# Altium schematic sheet ControlBoard.schdoc
size 297 x 209 mm; Symbol: Drawing-Symbol_A4; Company: 上海道尔汇控智能科技有限公司; Version: V1.1; Page Size: A4; @Project Name: YTM32; @Page Count: 1; @Update Date: 2025-12-09; @Create Date: 2025-10-20; @Schematic Name: YTM32_64pin; @Page No: 1; @Page Name: ControlBoard; @Create Time: 16:39:05; @Update Time: 20:38:16; Border: 1; Width: 1170; Height: 825; Region Start: 1; X Region Count: 6; Y Region Count: 4; Blade Width: 10; Title Block Position: 3; @Board Name: YTM32_64pin; Device: Drawing-Symbol_A4
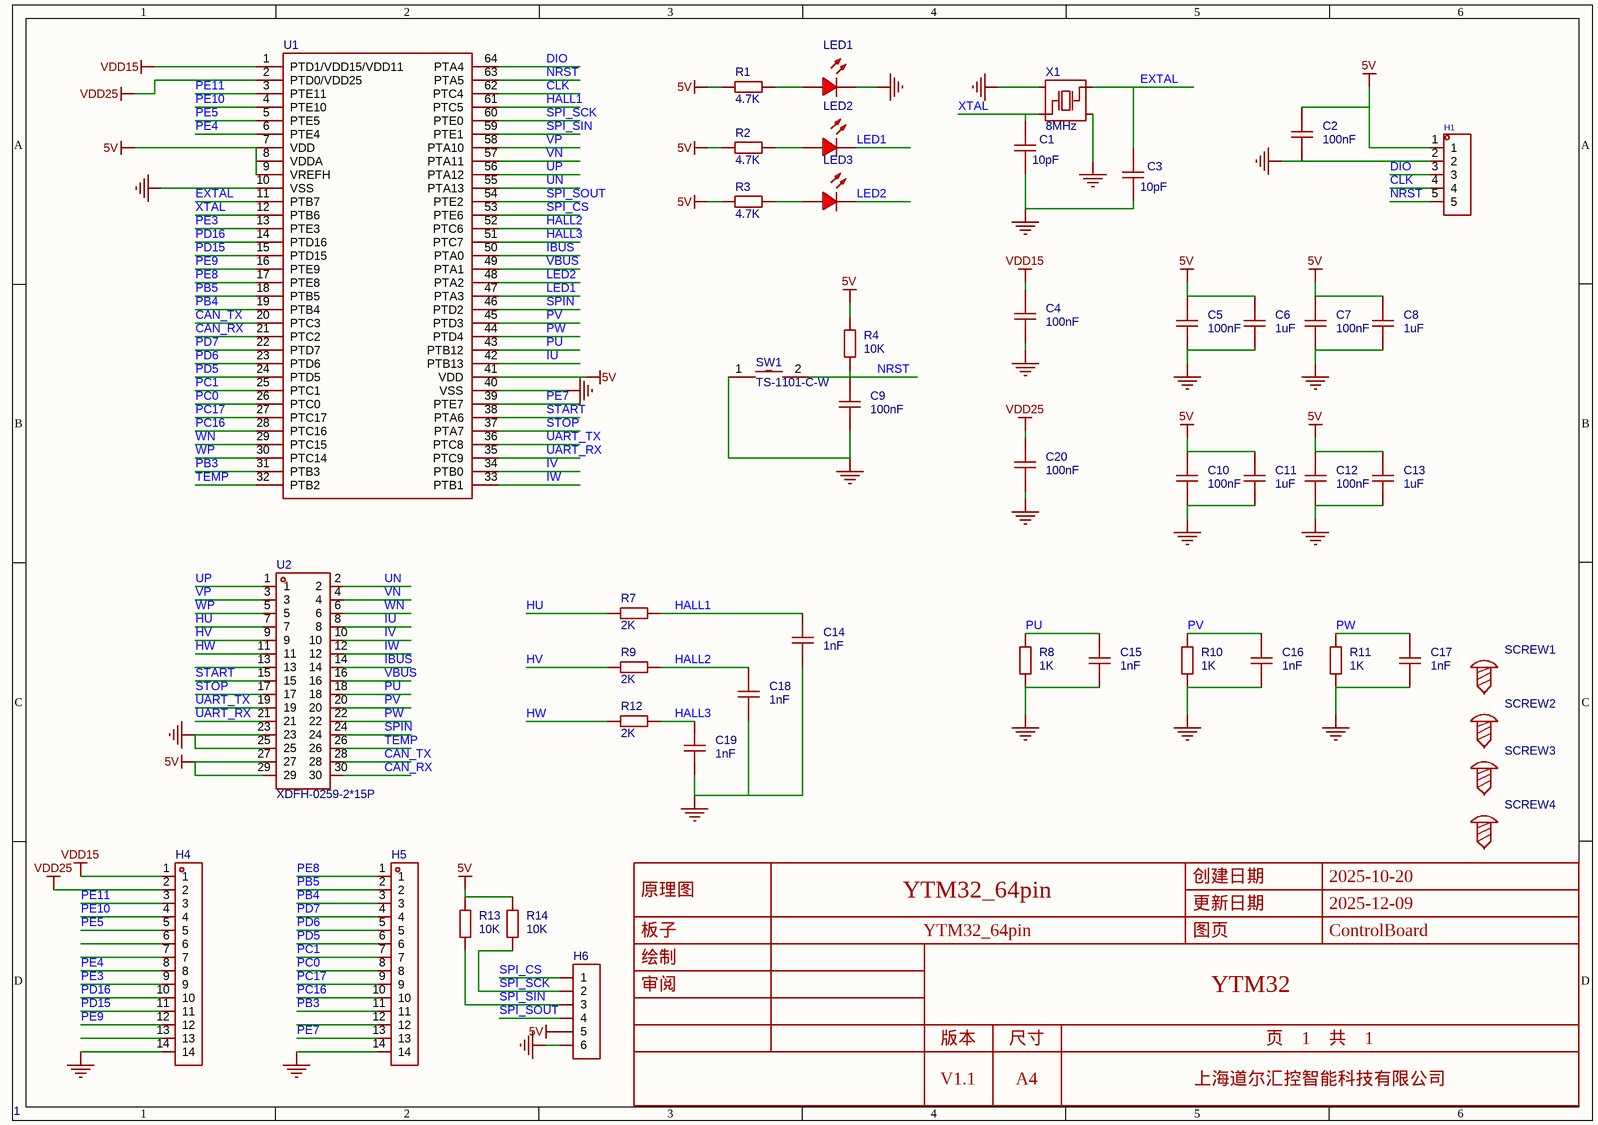
[diagram p0: ControlBoard.schdoc]

## Parts
C1  10pF  [C0603]
C2  100nF  [C0603]
C3  10pF  [C0603]
C4  100nF  [C0603]
C5  100nF  [C0603]
C6  1uF  [C0603]
C7  100nF  [C0603]
C8  1uF  [C0603]
C9  100nF  [C0603]
C10  100nF  [C0603]
C11  1uF  [C0603]
C12  100nF  [C0603]
C13  1uF  [C0603]
C14  1nF  [C0603]
C15  1nF  [C0603]
C16  1nF  [C0603]
C17  1nF  [C0603]
C18  1nF  [C0603]
C19  1nF  [C0603]
C20  100nF  [C0603]
H1  (no value)  [HDR-TH_5P-P2.54-V-M]
H4  (no value)  [HDR-TH_14P-P2.54-V-M]
H5  (no value)  [HDR-TH_14P-P2.54-V-M]
H6  (no value)  [HDR-TH_6P-P2.54-V-M-1]
LED1  (no value)  [LED_0603]
LED2  (no value)  [LED_0603]
LED3  (no value)  [LED_0603]
R1  4.7K  [R0603]
R2  4.7K  [R0603]
R3  4.7K  [R0603]
R4  10K  [R0603]
R7  2K  [R0603]
R8  1K  [R0603]
R9  2K  [R0603]
R10  1K  [R0603]
R11  1K  [R0603]
R12  2K  [R0603]
R13  10K  [R0603]
R14  10K  [R0603]
SCREW1  (no value)  [M3螺丝]
SCREW2  (no value)  [M3螺丝]
SCREW3  (no value)  [M3螺丝]
SCREW4  (no value)  [M3螺丝]
SW1  TS-1101-C-W  [SW-SMD_L6.0-W3.3-LS8.0]
U1  (no value)  [LQFP-64_L10.0-W10.0-P0.50-LS12.0-BL-2]
U2  XDFH-0259-2*15P  [CONN-TH_30P-P2.54_LX_XDFH-0259-2X15P]
X1  8MHz  [OSC-SMD_4P-L3.2-W2.5-BL]

## Nets
5V: C2.2 C5.2 C6.2 C7.2 C8.2 C10.2 C11.2 C12.2 C13.2 H1.1 H6.5 R1.1 R2.1 R3.1 R4.2 R13.2 R14.2 U1.7(VDD) U1.8(VDDA) U1.9(VREFH) U1.41(VDD) U2.27 U2.29
GND: C1.1 C2.1 C3.1 C4.1 C5.1 C6.1 C7.1 C8.1 C9.1 C10.1 C11.1 C12.1 C13.1 C14.1 C15.1 C16.1 C17.1 C18.1 C19.1 C20.1 H1.2 H4.14 H5.14 H6.6 LED1.1(C) R8.1 R10.1 R11.1 SW1.1 U1.10(VSS) U1.40(VSS) U2.23 U2.25 X1.2 X1.4
VDD15: C4.2 H4.1 U1.1(PTD1/VDD15/VDD11)
VDD25: C20.2 H4.2 U1.2(PTD0/VDD25)
CAN_RX: U1.21(PTC2) U2.30
CAN_TX: U1.20(PTC3) U2.28
CLK: H1.4 U1.62(PTC4)
DIO: H1.3 U1.64(PTA4)
EXTAL: C3.2 U1.11(PTB7) X1.3
HALL1: C14.2 R7.2 U1.61(PTC5)
HALL2: C18.2 R9.2 U1.52(PTC6)
HALL3: C19.2 R12.2 U1.51(PTC7)
HU: R7.1 U2.7
HV: R9.1 U2.9
HW: R12.1 U2.11
IBUS: U1.50(PTA0) U2.14
IU: U1.42(PTB13) U2.8
IV: U1.34(PTB0) U2.10
IW: U1.33(PTB1) U2.12
LED1: LED2.1(C) U1.47(PTA3)
LED2: LED3.1(C) U1.48(PTA2)
NRST: C9.2 H1.5 R4.1 SW1.2 U1.63(PTA5)
PB3: H5.11 U1.31(PTB3)
PB4: H5.3 U1.19(PTB4)
PB5: H5.2 U1.18(PTB5)
PC0: H5.8 U1.26(PTC0)
PC1: H5.7 U1.25(PTC1)
PC16: H5.10 U1.28(PTC16)
PC17: H5.9 U1.27(PTC17)
PD5: H5.6 U1.24(PTD5)
PD6: H5.5 U1.23(PTD6)
PD7: H5.4 U1.22(PTD7)
PD15: H4.11 U1.15(PTD15)
PD16: H4.10 U1.14(PTD16)
PE3: H4.9 U1.13(PTE3)
PE4: H4.8 U1.6(PTE4)
PE5: H4.5 U1.5(PTE5)
PE7: H5.13 U1.39(PTE7)
PE8: H5.1 U1.17(PTE8)
PE9: H4.12 U1.16(PTE9)
PE10: H4.4 U1.4(PTE10)
PE11: H4.3 U1.3(PTE11)
PU: C15.2 R8.2 U1.43(PTB12) U2.18
PV: C16.2 R10.2 U1.45(PTD3) U2.20
PW: C17.2 R11.2 U1.44(PTD4) U2.22
SPI_CS: H6.1 U1.53(PTE6)
SPI_SCK: H6.2 R14.1 U1.60(PTE0)
SPI_SIN: H6.3 R13.1 U1.59(PTE1)
SPI_SOUT: H6.4 U1.54(PTE2)
SPIN: U1.46(PTD2) U2.24
START: U1.38(PTA6) U2.15
STOP: U1.37(PTA7) U2.17
TEMP: U1.32(PTB2) U2.26
UART_RX: U1.35(PTC9) U2.21
UART_TX: U1.36(PTC8) U2.19
UN: U1.55(PTA13) U2.2
UP: U1.56(PTA12) U2.1
VBUS: U1.49(PTA1) U2.16
VN: U1.57(PTA11) U2.4
VP: U1.58(PTA10) U2.3
WN: U1.29(PTC15) U2.6
WP: U1.30(PTC14) U2.5
XTAL: C1.2 U1.12(PTB6) X1.1
NetLED1_2: LED1.2(A) R1.2
NetLED2_2: LED2.2(A) R2.2
NetLED3_2: LED3.2(A) R3.2

Not connected (* = marked no-connect by the designer): H4 6 7 13; H5 12; SCREW1 1; SCREW2 1; SCREW3 1; SCREW4 1; U2 13

## Notes on the sheet
- 创建日期
- 2025-10-20
- 原理图
- 板子
- YTM32_64pin
- 更新日期
- 图页
- 2025-12-09
- ControlBoard
- 绘制
- 审阅
- YTM32
- 版本
- V1.1
- 尺寸
- A4
- 页    1    共    1
- 上海道尔汇控智能科技有限公司
- 1

## Library data of the parts
C1-C20 = CAP_0603: ConvertToPcb: yes; SymbolName: CapAcitance; ModelId: ac125912035d415993ca9572d50418b1; ModelName: C0603_L1.6-W0.8-H0.8; ModelTransform: 62.992,31.496,0,0,0,0,0,0,0; Device: CAP_0603; AddInBom: yes; Supplier Footprint: 0603; FootprintName: C0603
  C1 C3: Value: 10pF
  C2 C4 C5 C7 C9 C10 C12 C20: Value: 100nF
  C6 C8 C11 C13: Value: 1uF
  C14-C19: Value: 1nF
H1 = HDR-M_2.54_1x5P: Manufacturer: MINTRON(明硕); Symbol: MTP125-1105S1; ConvertToPcb: yes; ModelId: 47d466e4a34f4fc5bc626cf773a24dd5; ModelName: HDR-TH_5P-P2.54-M-LI-1X5P; ModelTransform: 499.999,100,0,0,0,0,0,0,-118.11; Device: HDR-M_2.54_1x5P; Supplier: LCSC; Supplier Part: C358687; Manufacturer Part: MTP125-1105S1; JLCPCB Part Class: Extended Part; AddInBom: yes; Supplier Footprint: 插件; FootprintName: HDR-TH_5P-P2.54-V-M
H4 H5 = HDR-M_2.54_1x14P: 间距:2.54mm;总PIN位数:14;排数:1;插针结构:1x14P;行距:-;安装类型:直插;圆针/方针:方针;额定电流:3A;额定电压:-;配合针长度:6mm;塑高:2.5mm;端接针长度:3mm;触头材质:-;工作温度范围:-40℃~+105℃;颜色:黑色;; Symbol: HDR_2.54-1x14P; ConvertToPcb: yes; ModelId: d38966ad4fa34699b6d9af72e76b3bd5; ModelName: HDR-TH_14P-P2.54-M-LI-1X14P; ModelTransform: 1390.155,92.913,0,0,0,0,0,0,-137.795; Device: HDR-M_2.54_1x14P; AddInBom: yes; SupplierPart: C2894937; Supplier Footprint: 插件; FootprintName: HDR-TH_14P-P2.54-V-M
H6 = HDR-M_2.54_1x6P: Symbol: Header-Male-2.54_1x6; ConvertToPcb: yes; ModelId: 60739dffc9b04830a286435b0fefbd4a; ModelName: HDR2.54-M-LI-1X6P; ModelTransform: 599.999,100,0,0,0,0,0,0,-118.11; Device: HDR-M_2.54_1x6P; AddInBom: yes; SupplierPart: C37208; Supplier Footprint: 插件; FootprintName: HDR-TH_6P-P2.54-V-M-1
LED1-LED3 = LED_0603-R: Symbol: LED_R; Convert to PCB: yes; 3D Model: dd8257b0d61a4cd7b68939a056e08095; 3D Model Transform: 58.72,29.4,22.03,0,0,0,0,0,0; ModelName: LED-0603_R; Device: LED_0603-R; Add into BOM: yes; Supplier Footprint: 0603; FootprintName: LED_0603
R1-R4 R7-R14 = Res_0603: Symbol: 电阻; ConvertToPcb: yes; ModelId: fc143cca1e79419f9cd78b61e9279f08; ModelTransform: 31.8897,63.7794,0,90,0,0,0,0,0; Device: Res_0603; AddInBom: yes; Supplier Footprint: 0603; FootprintName: R0603; ModelName: R0603
  R1-R3: Value: 4.7K
  R4 R13 R14: Value: 10K
  R7 R9 R12: Value: 2K
  R8 R10 R11: Value: 1K
SCREW1-SCREW4 = M3螺丝: ConvertToPcb: yes; SymbolName: 螺丝孔; Device: M3螺丝; AddInBom: yes; Supplier Footprint: 插件; FootprintName: M3螺丝
SW1 = TS-1101-C-W: 电路结构:单刀单掷;按钮形状:矩形按钮;作用力:260gf;安装方式:立贴;开关长度:6mm;开关宽度:3.6mm;开关高度:2.5mm;带支架:不带;触点电流:50mA;额定电压(AC):-;额定电压(DC):12V;额定功率:-;绝缘电阻:-;带灯:无;机械寿命:5万次;; Manufacturer: XKB Connectivity(中国星坤); AddInBom: yes; ModelId: b2f4ea9f0afc4b0786d53dba66ceb9e4; ModelName: SW-SMD_L6.0-W3.3-H5-LS8.0; ModelTransform: 314.96,129.921,0,0,0,0,0,0,0; Circuit: 单刀单掷; Actuator Style: 矩形按钮; Operating Force: 260gf; Switch Length: 6mm; Switch Width: 3.6mm; Switch Height: 2.5mm; Strike Gundam: 不带; Contact Current: 50mA; Voltage Rating (DC): 12V; Actuator/Cap Color: 白色带淡绿; With Lamp: 无; Mechanical Life: 5万次; Symbol: TS-1101-C-W; Device: TS-1101-C-W; LCSC Part Name: 6*3.6*2.5mm 立贴 轻触开关; SupplierPart: C318938; ManufacturerPart: TS-1101-C-W; Supplier Footprint: SMD; JLCPCB Part Class: 扩展库; Datasheet: https://atta.szlcsc.com/upload/public/pdf/source/20200227/C318938_C2E53B1EEDE37D980A33616AC086DE53.pdf; Supplier: LCSC; ConvertToPcb: yes; FootprintName: SW-SMD_L6.0-W3.3-LS8.0; Mounting Style: 立贴; Voltage Rating (AC): -; Power Rating: -; Insulation Resistance: -; IP Rating: -; Pin Style: -; Operating Temperature: -30℃~+85℃
U1 = YTM32B1MD2x_64pin: AddInBom: yes; Device: YTM32B1MD2x_64pin; SymbolName: YTM32B1MD2x_64pin; ConvertToPcb: yes; FootprintName: LQFP-64_L10.0-W10.0-P0.50-LS12.0-BL-2
U2 = XDFH-0259-2*15P: 连接器类型:简牛座;间距:2.54mm;结构:2x15P;额定电流:3A;额定电压:500V;封装形式:弯插;排数:2;每排PIN数:15;触头材质:铜;触头镀层:金;工作温度范围:-45℃~+105℃;; Manufacturer: LX(连欣科技); AddInBom: yes; ModelId: 5c3b8136d5a14d27ae11c9ec27ec7f0d; ModelTransform: 1799.209,492.9124,0,0,0,0,0,185.039,-129.921; Connector Type: 简牛座; Pitch: 2.54mm; Number of Positions or Pins: 2x15P; Current Rating: 3A; Voltage Rating (Max): 500V; Holder Type: 弯插; Number of PINs Per Row: 15; Symbol: XDFH-0259-2*15P; Device: XDFH-0259-2*15P; LCSC Part Name: 2U镀金PH2.54MM-2*15PIN卧插简牛插座专用; SupplierPart: C19193828; ManufacturerPart: XDFH-0259-2*15P; Supplier Footprint: 弯插,P=2.54mm; JLCPCB Part Class: 扩展库; Datasheet: https://atta.szlcsc.com/upload/public/pdf/source/20231117/460E6BB7C0FB7D45FB9AB0ED1A0F90C2.pdf; Supplier: LCSC; ConvertToPcb: yes; FootprintName: CONN-TH_30P-P2.54_LX_XDFH-0259-2X15P; ModelName: CONN-TH_30P-P2.54_LX_XDFH-0259-2X15P; Number of Rows: 2; Contact Material: 铜; Contact Plating: 金; Operating Temperature: -45℃~+105℃
X1 = TAXM8M4RDBCCT2T: 晶振类型:贴片晶振;频率:8MHz;常温频差:±10ppm;外接负载电容:10pF;频率稳定度(全温):±15ppm;; Manufacturer: YJX(雅晶鑫); AddInBom: yes; ModelId: ae22b8d143894765bc8100c37cb6356f; ModelName: OSC-SMD_4P-L3.2-W2.5-H1.0; ModelTransform: 125.984,98.425,0,0,0,0,0,0,0; Crystal Type: 贴片晶振; Normal temperature Frequency Tolerance: ±10ppm; External load capacitor: 10pF; Frequency Stability(Full temperature range): ±15ppm; Equivalent Series Resistance (ESR): 250Ω; Symbol: TAXM8M4RDBCCT2T; Device: TAXM8M4RDBCCT2T; LCSC Part Name: 8MHz ±10ppm 10pF; SupplierPart: C400090; ManufacturerPart: TAXM8M4RDBCCT2T; Supplier Footprint: SMD3225-4P; JLCPCB Part Class: 扩展库; Datasheet: https://atta.szlcsc.com/upload/public/pdf/source/20190626/C400090_CF95B89E745AFE4EF2E392EF8AC009D6.pdf; Supplier: LCSC; ConvertToPcb: yes; FootprintName: OSC-SMD_4P-L3.2-W2.5-BL; Value: 8MHz; Operating Temperature: -40℃~+85℃